# Altium project Zotino-DIOT.PrjPCB (part 5 of 5)

## Sheet Zotino-connector.SchDoc
size A3
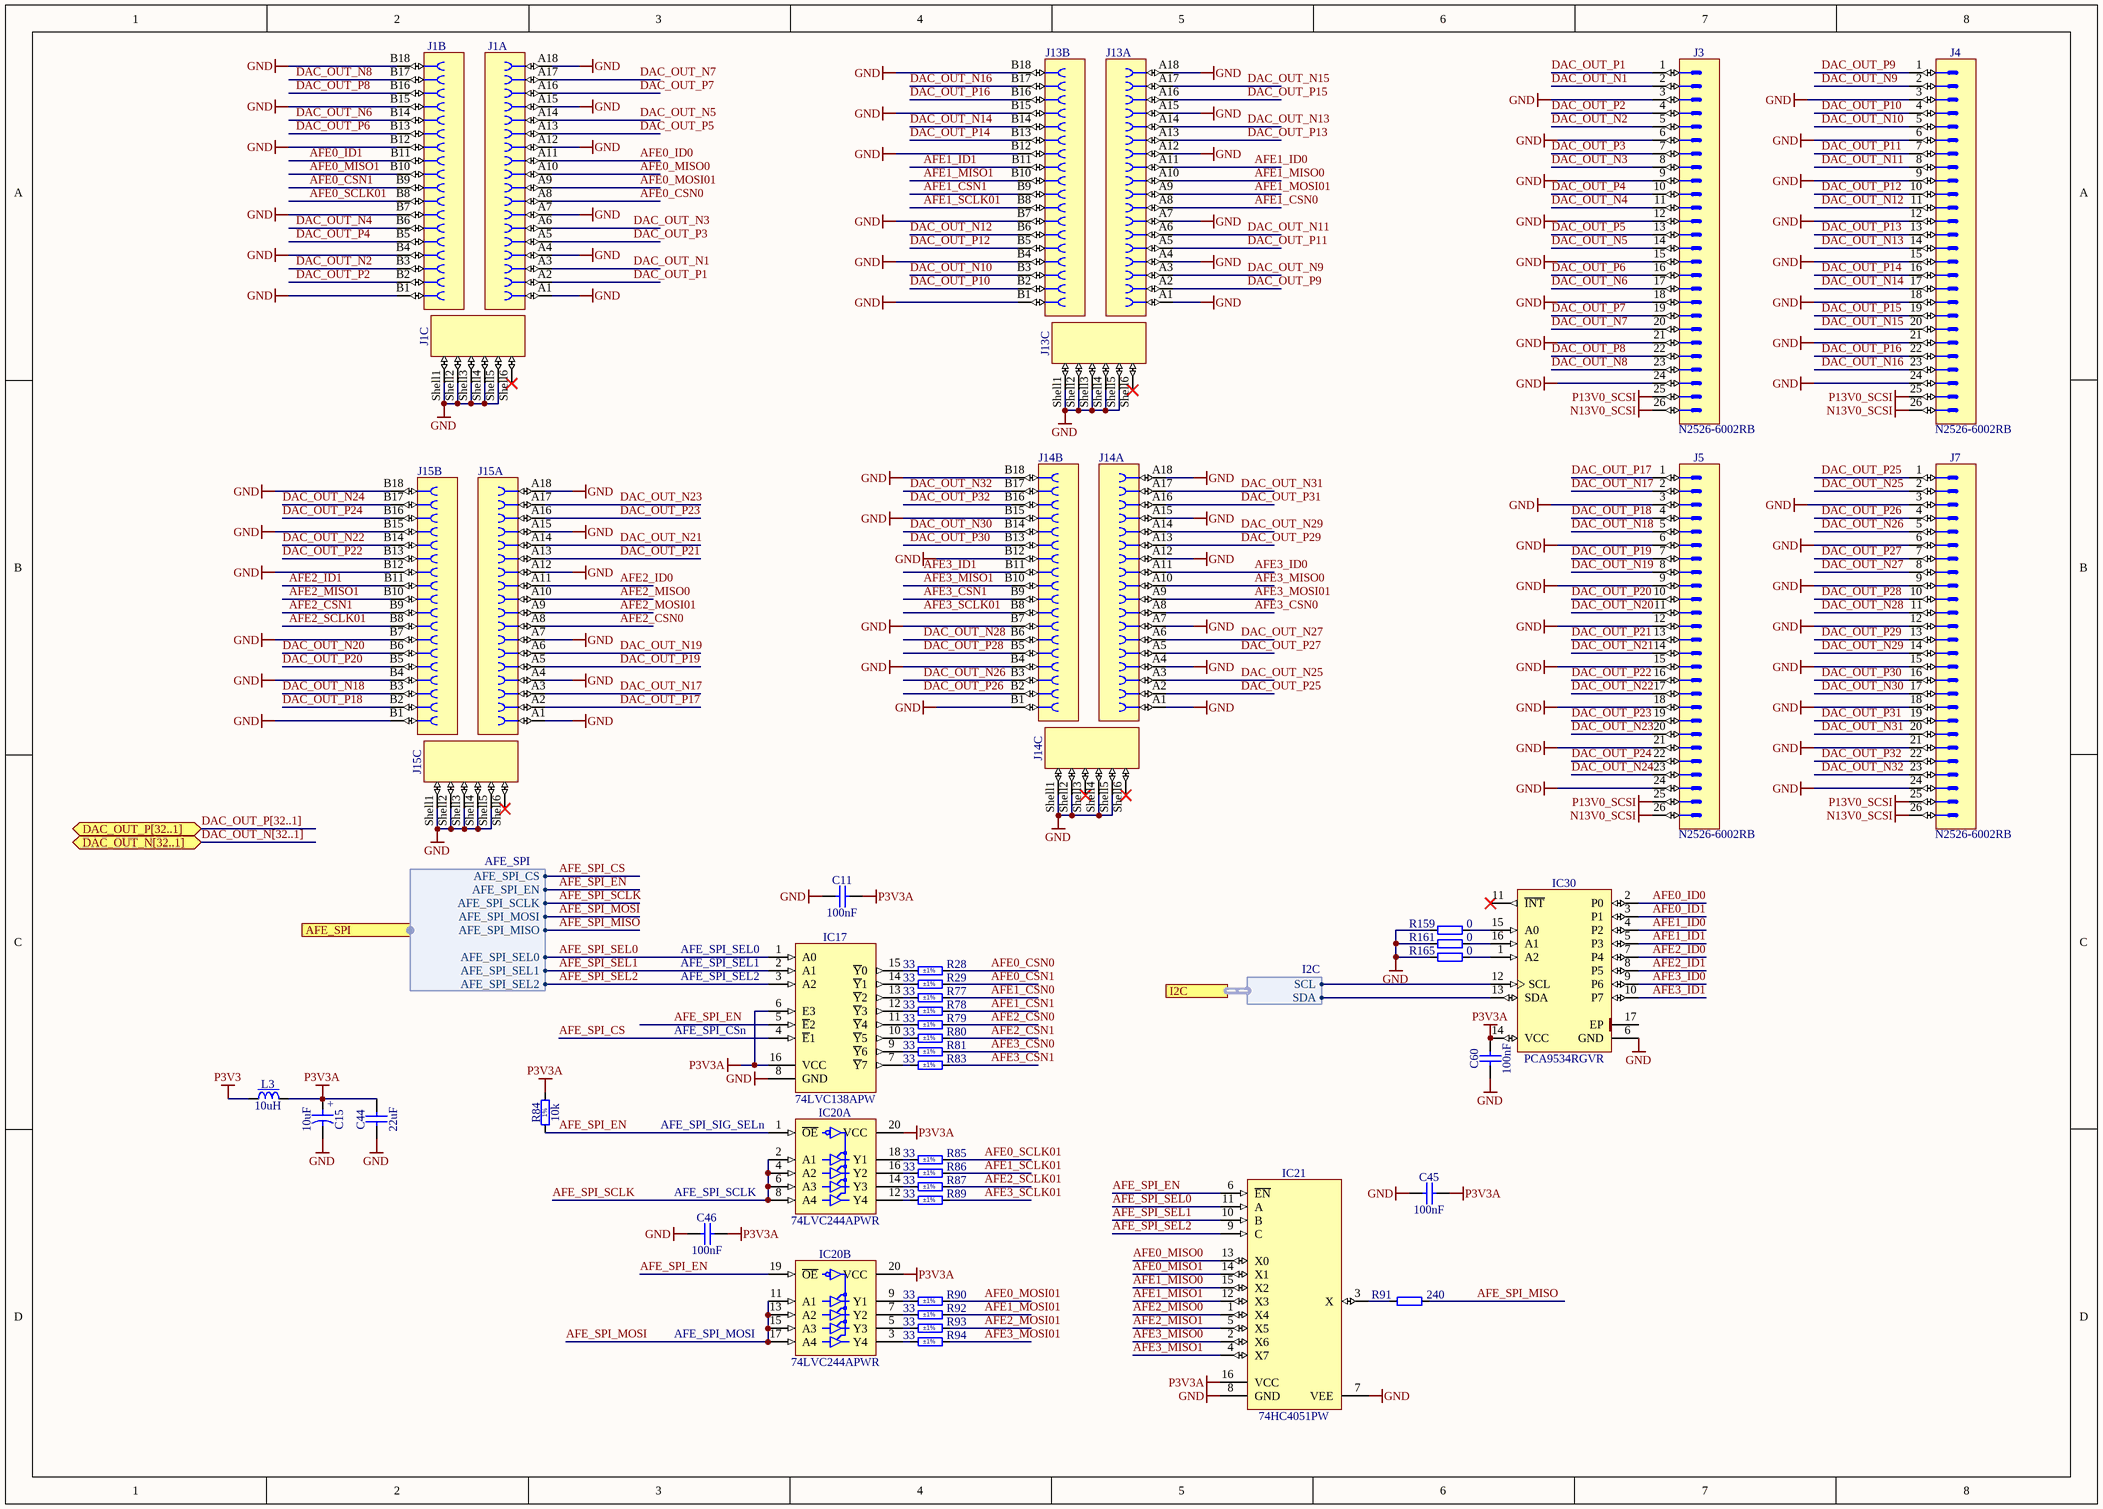
[diagram p7: Zotino-connector.SchDoc]

### Parts
C11  100nF  [CAPC1005X55N]
C15  10uF  [CAPMP3216X180N]
C44  22uF  [CAPC2012X135N]
C45  100nF  [CAPC1005X55N]
C46  100nF  [CAPC1005X55N]
C60  100nF  [CAPC1005X55N]
IC17  74LVC138APW  [SOP65P640X110-16N]
IC20  74LVC244APWR  [SOP65P640X110-20N]  (parts A,B of 2)
IC21  74HC4051PW  [SOP65P640X120-16N]
IC30  PCA9534RGVR  [QFN65P400X400X100-17N-S225]
J1  iPass™  [MOLEX_75783-0107]  (value not drawn)  (parts A,B,C of 3)
J3  Manufacturer Part Number: N2526-6002RB  [3M_N2526-6002RB]  (hidden comment: Header 26)
J4  Manufacturer Part Number: N2526-6002RB  [3M_N2526-6002RB]  (hidden comment: Header 26)
J5  Manufacturer Part Number: N2526-6002RB  [3M_N2526-6002RB]  (hidden comment: Header 26)
J7  Manufacturer Part Number: N2526-6002RB  [3M_N2526-6002RB]  (hidden comment: Header 26)
J13  iPass™  [MOLEX_75783-0107]  (value not drawn)  (parts A,B,C of 3)
J14  iPass™  [MOLEX_75783-0107]  (value not drawn)  (parts A,B,C of 3)
J15  iPass™  [MOLEX_75783-0107]  (value not drawn)  (parts A,B,C of 3)
L3  10uH  [IND_MURATA-PS_8400]
R28  33  Tolerance: ±1%  [RESC1005X40N]
R29  33  Tolerance: ±1%  [RESC1005X40N]
R77  33  Tolerance: ±1%  [RESC1005X40N]
R78  33  Tolerance: ±1%  [RESC1005X40N]
R79  33  Tolerance: ±1%  [RESC1005X40N]
R80  33  Tolerance: ±1%  [RESC1005X40N]
R81  33  Tolerance: ±1%  [RESC1005X40N]
R83  33  Tolerance: ±1%  [RESC1005X40N]
R84  10k  [RESC1005X40N]
R85  33  Tolerance: ±1%  [RESC1005X40N]
R86  33  Tolerance: ±1%  [RESC1005X40N]
R87  33  Tolerance: ±1%  [RESC1005X40N]
R89  33  Tolerance: ±1%  [RESC1005X40N]
R90  33  Tolerance: ±1%  [RESC1005X40N]
R91  240  [RESC1005X40N]
R92  33  Tolerance: ±1%  [RESC1005X40N]
R93  33  Tolerance: ±1%  [RESC1005X40N]
R94  33  Tolerance: ±1%  [RESC1005X40N]
R159  0  [RESC1005X40N]
R161  0  [RESC1005X40N]
R165  0  [RESC1005X40N]

### Ports
AFE_SPI (harness AFE_SPI), DAC_OUT_N[32..1] (bidir), DAC_OUT_P[32..1] (bidir), I2C (harness I2C)

### Harnesses
AFE_SPI: AFE_SPI_CS, AFE_SPI_EN, AFE_SPI_SCLK, AFE_SPI_MOSI, AFE_SPI_MISO, AFE_SPI_SEL0, AFE_SPI_SEL1, AFE_SPI_SEL2
I2C: SDA, SCL

### Nets
GND: C11.1 C15.2 C44.1 C45.1 C46.1 C60.1 IC17.8(GND) IC20.10(GND) IC21.7(VEE) IC21.8(GND) IC30.6(GND) J1.A1 J1.A4 J1.A7 J1.A12 J1.A15 J1.A18 J1.B1 J1.B4 J1.B7 J1.B12 J1.B15 J1.B18 J1.Shell1 J1.Shell2 J1.Shell3 J1.Shell4 J1.Shell5 J3.3 J3.6 J3.9 J3.12 J3.15 J3.18 J3.21 J3.24 J4.3 J4.6 J4.9 J4.12 J4.15 J4.18 J4.21 J4.24 J5.3 J5.6 J5.9 J5.12 J5.15 J5.18 J5.21 J5.24 J7.3 J7.6 J7.9 J7.12 J7.15 J7.18 J7.21 J7.24 J13.A1 J13.A4 J13.A7 J13.A12 J13.A15 J13.A18 J13.B1 J13.B4 J13.B7 J13.B12 J13.B15 J13.B18 J13.Shell1 J13.Shell2 J13.Shell3 J13.Shell4 J13.Shell5 J14.A1 J14.A4 J14.A7 J14.A12 J14.A15 J14.A18 J14.B1 J14.B4 J14.B7 J14.B12 J14.B15 J14.B18 J14.Shell1 J14.Shell2 J14.Shell4 J14.Shell5 J15.A1 J15.A4 J15.A7 J15.A12 J15.A15 J15.A18 J15.B1 J15.B4 J15.B7 J15.B12 J15.B15 J15.B18 J15.Shell1 J15.Shell2 J15.Shell3 J15.Shell4 J15.Shell5 R159.1 R161.1 R165.1
N13V0_SCSI: J3.26 J4.26 J5.26 J7.26
P3V3: L3.1
P3V3A: C11.2 C15.1 C44.2 C45.2 C46.2 C60.2 IC17.6(E3) IC17.16(VCC) IC20.20(VCC) IC21.16(VCC) IC30.14(VCC) L3.2 R84.2
P13V0_SCSI: J3.25 J4.25 J5.25 J7.25
AFE0_CSN0: J1.A8 R28.2
AFE0_CSN1: J1.B9 R29.2
AFE0_ID0: IC30.2(P0) J1.A11
AFE0_ID1: IC30.3(P1) J1.B11
AFE0_MISO0: IC21.13(X0) J1.A10
AFE0_MISO1: IC21.14(X1) J1.B10
AFE0_MOSI01: J1.A9 R90.2
AFE0_SCLK01: J1.B8 R85.2
AFE1_CSN0: J13.A8 R77.2
AFE1_CSN1: J13.B9 R78.2
AFE1_ID0: IC30.4(P2) J13.A11
AFE1_ID1: IC30.5(P3) J13.B11
AFE1_MISO0: IC21.15(X2) J13.A10
AFE1_MISO1: IC21.12(X3) J13.B10
AFE1_MOSI01: J13.A9 R92.2
AFE1_SCLK01: J13.B8 R86.2
AFE2_CSN0: J15.A8 R79.2
AFE2_CSN1: J15.B9 R80.2
AFE2_ID0: IC30.7(P4) J15.A11
AFE2_ID1: IC30.8(P5) J15.B11
AFE2_MISO0: IC21.1(X4) J15.A10
AFE2_MISO1: IC21.5(X5) J15.B10
AFE2_MOSI01: J15.A9 R93.2
AFE2_SCLK01: J15.B8 R87.2
AFE3_CSN0: J14.A8 R81.2
AFE3_CSN1: J14.B9 R83.2
AFE3_ID0: IC30.9(P6) J14.A11
AFE3_ID1: IC30.10(P7) J14.B11
AFE3_MISO0: IC21.2(X6) J14.A10
AFE3_MISO1: IC21.4(X7) J14.B10
AFE3_MOSI01: J14.A9 R94.2
AFE3_SCLK01: J14.B8 R89.2
AFE_SPI_CS: IC17.4(~{E}1) ; port AFE_SPI.AFE_SPI_CS
AFE_SPI_EN: IC17.5(~{E}2) IC20.1(~{OE}) IC20.19(~{OE}) IC21.6(~{EN}) R84.1 ; port AFE_SPI.AFE_SPI_EN
AFE_SPI_MISO: R91.2 ; port AFE_SPI.AFE_SPI_MISO
AFE_SPI_MOSI: IC20.11(A1) IC20.13(A2) IC20.15(A3) IC20.17(A4) ; port AFE_SPI.AFE_SPI_MOSI
AFE_SPI_SCLK: IC20.2(A1) IC20.4(A2) IC20.6(A3) IC20.8(A4) ; port AFE_SPI.AFE_SPI_SCLK
AFE_SPI_SEL0: IC17.1(A0) IC21.11(A) ; port AFE_SPI.AFE_SPI_SEL0
AFE_SPI_SEL1: IC17.2(A1) IC21.10(B) ; port AFE_SPI.AFE_SPI_SEL1
AFE_SPI_SEL2: IC17.3(A2) IC21.9(C) ; port AFE_SPI.AFE_SPI_SEL2
DAC_OUT_N1: J1.A3 J3.2
DAC_OUT_N2: J1.B3 J3.5
DAC_OUT_N3: J1.A6 J3.8
DAC_OUT_N4: J1.B6 J3.11
DAC_OUT_N5: J1.A14 J3.14
DAC_OUT_N6: J1.B14 J3.17
DAC_OUT_N7: J1.A17 J3.20
DAC_OUT_N8: J1.B17 J3.23
DAC_OUT_N9: J4.2 J13.A3
DAC_OUT_N10: J4.5 J13.B3
DAC_OUT_N11: J4.8 J13.A6
DAC_OUT_N12: J4.11 J13.B6
DAC_OUT_N13: J4.14 J13.A14
DAC_OUT_N14: J4.17 J13.B14
DAC_OUT_N15: J4.20 J13.A17
DAC_OUT_N16: J4.23 J13.B17
DAC_OUT_N17: J5.2 J15.A3
DAC_OUT_N18: J5.5 J15.B3
DAC_OUT_N19: J5.8 J15.A6
DAC_OUT_N20: J5.11 J15.B6
DAC_OUT_N21: J5.14 J15.A14
DAC_OUT_N22: J5.17 J15.B14
DAC_OUT_N23: J5.20 J15.A17
DAC_OUT_N24: J5.23 J15.B17
DAC_OUT_N25: J7.2 J14.A3
DAC_OUT_N26: J7.5 J14.B3
DAC_OUT_N27: J7.8 J14.A6
DAC_OUT_N28: J7.11 J14.B6
DAC_OUT_N29: J7.14 J14.A14
DAC_OUT_N30: J7.17 J14.B14
DAC_OUT_N31: J7.20 J14.A17
DAC_OUT_N32: J7.23 J14.B17
DAC_OUT_P1: J1.A2 J3.1
DAC_OUT_P2: J1.B2 J3.4
DAC_OUT_P3: J1.A5 J3.7
DAC_OUT_P4: J1.B5 J3.10
DAC_OUT_P5: J1.A13 J3.13
DAC_OUT_P6: J1.B13 J3.16
DAC_OUT_P7: J1.A16 J3.19
DAC_OUT_P8: J1.B16 J3.22
DAC_OUT_P9: J4.1 J13.A2
DAC_OUT_P10: J4.4 J13.B2
DAC_OUT_P11: J4.7 J13.A5
DAC_OUT_P12: J4.10 J13.B5
DAC_OUT_P13: J4.13 J13.A13
DAC_OUT_P14: J4.16 J13.B13
DAC_OUT_P15: J4.19 J13.A16
DAC_OUT_P16: J4.22 J13.B16
DAC_OUT_P17: J5.1 J15.A2
DAC_OUT_P18: J5.4 J15.B2
DAC_OUT_P19: J5.7 J15.A5
DAC_OUT_P20: J5.10 J15.B5
DAC_OUT_P21: J5.13 J15.A13
DAC_OUT_P22: J5.16 J15.B13
DAC_OUT_P23: J5.19 J15.A16
DAC_OUT_P24: J5.22 J15.B16
DAC_OUT_P25: J7.1 J14.A2
DAC_OUT_P26: J7.4 J14.B2
DAC_OUT_P27: J7.7 J14.A5
DAC_OUT_P28: J7.10 J14.B5
DAC_OUT_P29: J7.13 J14.A13
DAC_OUT_P30: J7.16 J14.B13
DAC_OUT_P31: J7.19 J14.A16
DAC_OUT_P32: J7.22 J14.B16
I2C_SCL: IC30.12(SCL) ; port I2C.SCL
I2C_SDA: IC30.13(SDA) ; port I2C.SDA
NetIC17_7: IC17.7(~{Y}7) R83.1
NetIC17_9: IC17.9(~{Y}6) R81.1
NetIC17_10: IC17.10(~{Y}5) R80.1
NetIC17_11: IC17.11(~{Y}4) R79.1
NetIC17_12: IC17.12(~{Y}3) R78.1
NetIC17_13: IC17.13(~{Y}2) R77.1
NetIC17_14: IC17.14(~{Y}1) R29.1
NetIC17_15: IC17.15(~{Y}0) R28.1
NetIC20_3: IC20.3(Y4) R94.1
NetIC20_5: IC20.5(Y3) R93.1
NetIC20_7: IC20.7(Y2) R92.1
NetIC20_9: IC20.9(Y1) R90.1
NetIC20_12: IC20.12(Y4) R89.1
NetIC20_14: IC20.14(Y3) R87.1
NetIC20_16: IC20.16(Y2) R86.1
NetIC20_18: IC20.18(Y1) R85.1
NetIC21_3: IC21.3(X) R91.1
NetIC30_1: IC30.1(A2) R165.2
NetIC30_15: IC30.15(A0) R159.2
NetIC30_16: IC30.16(A1) R161.2

Not connected (* = marked no-connect by the designer): IC30 11(~{INT})* 17(EP); J1 Shell6*; J13 Shell6*; J14 Shell3* Shell6*; J15 Shell6*

### Buses and harness runs
bus DAC_OUT_N[32..1] = port DAC_OUT_N[32..1]
bus DAC_OUT_P[32..1] = port DAC_OUT_P[32..1]

### Notes on the sheet
- (near IC17) AFE_SPI_SEL0
- (near IC17) AFE_SPI_SEL1
- (near IC17) AFE_SPI_SEL2
- AFE_SPI_CSn
- AFE_SPI_SIG_SELn
- AFE_SPI_SCLK
- (near IC20) AFE_SPI_MOSI
- (in symbol CTE3216-18_10UF_16V_20%_AVX_TCJ) +
- (in symbol R0402_10K_1%_0.0625W_100PPM) 1%

### Library data of the parts
C11 C45 C46 C60 = CC0402_100NF_16V_10%_X5R: Non-polarised capacitor; Part Description: SMD Multilayer Chip Ceramic Capacitor; Manufacturer: GENERIC; Manufacturer1 Part Number: GRM155R61C104KA88D; Voltage: 16V; TC: X5R; Tolerance: ±10%; Part Number: CC0402_100NF_16V_10%_X5R; Component Kind: Standard; Component Type: Standard; Pin Count: 2; Value: 100nF; Status: None; Manufacturer Part Number: CC0402_100NF_16V_10%_X5R; Case: 0402; Mounted: Yes; Socket: No; SMD: Yes; Sense: No; Manufacturer1 Example: MURATA; Manufacturer1 ComponentHeight: 0.55mm; HelpURL: \\cern.ch\dfs\Applications\Altium\Datasheets\CC0402_X5R_MURATA_GRM.pdf; Author: CERN DEM JLC; CreateDate: 10.12.2013; LatestRevisionDate: 10.12.2013
C15 = CTE3216-18_10UF_16V_20%_AVX_TCJ: Polarised capacitor; Part Description: ESR 0R200 Tantalum Solid Electrolytic Chip Capacitor with Conductive Polymer Electrode; Manufacturer: AVX; Manufacturer Part Number: TCJA106M016R0200 or  or TR3A106K016C1700; Voltage: 16V; Tolerance: ±20%; Part Number: CTE3216-18_10UF_16V_20%_AVX_TCJ; Component Kind: Standard; Component Type: Standard; Pin Count: 2; Value: 10uF; Status: Preferred; Case: A; Mounted: Yes; Socket: No; SMD: Yes; Sense: No; ComponentHeight: 1.8mm; HelpURL: \\cern.ch\dfs\Applications\Altium\Datasheets\CTE_AVX_TCJ.pdf; Author: CERN DEM JLC; CreateDate: 29.03.2012; LatestRevisionDate: 29.03.2012
C44 = CC0805_22UF_16V_10%_X5R: Non-polarised capacitor; Part Description: SMD Multilayer Chip Ceramic Capacitor; Manufacturer: GENERIC; Manufacturer1 Part Number: C2012X5R1C226KT; Voltage: 16V; TC: X5R; Tolerance: ±10%; Part Number: CC0805_22UF_16V_10%_X5R; Component Kind: Standard; Component Type: Standard; Pin Count: 2; Value: 22uF; Status: Preferred; Manufacturer Part Number: CC0805_22UF_16V_10%_X5R; Case: 0805; Mounted: Yes; Socket: No; SMD: Yes; Sense: No; Manufacturer1 Example: TDK; Manufacturer1 ComponentHeight: 1.35mm; HelpURL: \\cern.ch\dfs\Applications\Altium\Datasheets\CC0805_X5R_TDK_C.pdf; Author: CERN DEM JLC; CreateDate: 25.10.2012; LatestRevisionDate: 25.10.2012
IC17 = 74LVC138APW: 3-Line to 8-Line Decoder/Demultiplexer; Part Description: 3-Line to 8-Line Decoder/Demultiplexer, Inverting; Manufacturer: NEXPERIA; PressFit: No; Bonding: No; Part Number: 74LVC138APW; Component Kind: Standard; Component Type: Standard; Device: 74LVC138APW; PackageDescription: SOP, 0.65mm Pitch; 16 Pin, 4.40mm W X 5.00mm L X 1.10mm H body IPC Medium Density; Manufacturer Part Number: 74LVC138APW; Pin Count: 16; Case: TSSOP16; Mounted: Yes; Socket: No; SMD: Yes; Sense: No; ComponentHeight: 1.1mm; Author: CERN DEM HF; HelpURL: \\cern.ch\dfs\Applications\Altium\Datasheets\74LVC138A.pdf; CreateDate: 14.10.2022; LatestRevisionDate: 14.10.2022
IC20 = 74LVC244APW: Octal Buffer/Driver with 3-State Ouputs; Part Description: Octal Buffer/Driver with 3-State Outputs; Manufacturer: TEXAS INSTRUMENTS; PressFit: No; Bonding: No; Part Number: 74LVC244APWR; Component Kind: Standard; Component Type: Standard; Device: 74LVC244APWR; PackageDescription: SOP, 20-Leads, Body 6.6x4.5mm (max), Pitch 0.65mm, IPC Medium Density; Manufacturer Part Number: 74LVC244APW; Pin Count: 20; Case: TSSOP20; Mounted: Yes; Socket: No; SMD: Yes; Sense: No; ComponentHeight: 1.1mm; Author: GK; HelpURL: \\cern.ch\dfs\Applications\Altium\Datasheets\SN74LVC244A.pdf; CreateDate: 20.12.2010; LatestRevisionDate: 22.03.2021
IC21 = 74HC4051PW: 8-Channel Analog Multiplexer/Demultiplexer; Manufacturer: NXP; PressFit: No; Bonding: No; Part Number: 74HC4051PW; Component Kind: Standard; Component Type: Standard; Device: 74HC4051PW; PackageDescription: SOP, 0.65mm Pitch; 16 Pin, 4.40mm W X 5.00mm L X 1.20mm H body, IPC Medium Density; Part Description: 8-Channel Analog Multiplexer/Demultiplexer; Manufacturer Part Number: 74HC4051PW; Pin Count: 16; Case: TSSOP16; Mounted: Yes; Socket: No; SMD: Yes; Sense: No; ComponentHeight: 1.2mm; Author: GK; HelpURL: \\cern.ch\dfs\Applications\Altium\Datasheets\TC74HC4051AFT.pdf; CreateDate: 09.11.2011; LatestRevisionDate: 09.11.2011
IC30 = PCA9534RGVR: Remote 8-Bit I2C and SMBus Low-Power I/O Expander With Interrupt Output and Configuration Registers; Manufacturer: TEXAS INSTRUMENTS; PressFit: No; Bonding: No; Part Number: PCA9534RGVR; Component Kind: Standard; Component Type: Standard; Device: PCA9534RGVR; PackageDescription: QFN, 0.65mm Pitch, Square; 16 Pin, 4.00mm L X 4.00mm W X 1.00mm H body (w/Thermal Tab 2.25 X 2.25mm), IPC Medium Density; Part Description: Remote 8-Bit I2C and SMBus Low-Power I/O Expander with Interrupt Output and Configuration Registers; Manufacturer Part Number: PCA9534RGV; Pin Count: 17; Case: QFN16; Mounted: Yes; Socket: No; SMD: Yes; Sense: No; ComponentHeight: 1mm; Author: CERN DEM JLC; HelpURL: \\cern.ch\dfs\Applications\Altium\Datasheets\PCA9534RGVR.pdf; CreateDate: 23.05.2018; LatestRevisionDate: 13.06.2022
J1 J13-J15 = MOLEX_75783-0107: 36 Circuit, Right Angle , Internal Assembly, iPass™ I/O Surface Mount Receptacle with Left Key Shell; Part Number: MOLEX 75783-0107 / 75783-0136; Manufacturer: MOLEX; Manufacturer Part Number: 75783-0107 / 75783-0136; PressFit: No; Component Kind: Standard; Component Type: Standard; Pin Count: 42; Family: iPass™; Mounted: Yes; Socket: No; SMD: Yes; Sense: No; Status: None; Part Description: 36 Circuit, Right Angle , Internal Assembly, iPass™ I/O Surface Mount Receptacle with Left Key Shell; ComponentHeight: 8.47mm; HelpURL: \\cern.ch\dfs\Applications\Altium\Datasheets\MOLEX_75783-0107.pdf; Author: CERN DEM JLC; CreateDate: 12.11.2014; LatestRevisionDate: 12.11.2014
J3-J5 J7 = 3M_N2526-6002RB: Connector 26 Male; Part Description: 26 Contacts - Straight .100'' x .100'' Low Profile Four-Wall Header, 2500 Series; Manufacturer: 3M; PressFit: No; Part Number: 3M_N2526-6002RB; Component Kind: Standard; Component Type: Standard; Pin Count: 26; Family: Header 26; Mounted: Yes; Socket: No; SMD: No; Sense: No; Status: None; ComponentHeight: 10.03mm; HelpURL: \\cern.ch\dfs\Applications\Altium\Datasheets\3M_N2526-6002RB.pdf; Author: CERN DEM JLC; CreateDate: 11.02.2009; LatestRevisionDate: 11.08.2009
L3 = IND_10UH_10%_MURATA-PS_8400: Inductor With Core; Part Description: Miniature Surface Mount Power Inductor (8400 Serie); Manufacturer: MURATA POWER SOLUTIONS; Manufacturer Part Number: 84103C; Power: 950mA; Resistance: 0.24R; Tolerance: ±10%; Part Number: IND_10UH_10%_MURATA-PS_8400; Component Kind: Standard; Component Type: Standard; Pin Count: 2; Value: 10uH; Status: None; Mounted: Yes; Socket: No; SMD: Yes; Sense: No; ComponentHeight: 2.9mm; HelpURL: \\cern.ch\dfs\Applications\Altium\Datasheets\IND_MURATA-PS_8400.pdf; Author: CERN DEM JLC; CreateDate: 02.07.2012; LatestRevisionDate: 02.07.2012
R28 R29 R77-R81 R83 R85-R87 R89 R90 R92-R94 = R0402_33R_1%_0.0625W_100PPM: Resistor - 1%; Part Description: General Purpose Thick Film Chip Resistor; Manufacturer: GENERIC; Manufacturer1 Part Number: 232270673309L; TC: ±100ppm/°C; PressFit: No; Part Number: R0402_33R_1%_0.0625W_100PPM; Component Kind: Standard; Component Type: Standard; Pin Count: 2; Value: 33; Status: Not Recommended; Power: 0.0625W; Manufacturer Part Number: R0402_33R_1%_0.0625W_100PPM; Case: 0402; Mounted: Yes; Sense: No; Socket: No; SMD: Yes; Manufacturer1 Example: YAGEO PHYCOMP; Manufacturer1 ComponentHeight: 0.4mm; HelpURL: \\cern.ch\dfs\Applications\Altium\Datasheets\R0402_Phycomp_RC0402.pdf; Author: CERN DEM JLC; CreateDate: 03.12.2007; LatestRevisionDate: 17.10.2012
R84 = R0402_10K_1%_0.0625W_100PPM: Resistor - 1%; Part Description: General Purpose Thick Film Chip Resistor; Manufacturer: GENERIC; Manufacturer1 Part Number: 232270671003L; TC: ±100ppm/°C; PressFit: No; Part Number: R0402_10K_1%_0.0625W_100PPM; Component Kind: Standard; Component Type: Standard; Pin Count: 2; Value: 10k; Status: Not Recommended; Power: 0.0625W; Tolerance: ±1%; Manufacturer Part Number: R0402_10K_1%_0.0625W_100PPM; Case: 0402; Mounted: Yes; Sense: No; Socket: No; SMD: Yes; Manufacturer1 Example: YAGEO PHYCOMP; Manufacturer1 ComponentHeight: 0.4mm; HelpURL: \\cern.ch\dfs\Applications\Altium\Datasheets\R0402_Phycomp_RC0402.pdf; Author: CERN DEM JLC; CreateDate: 03.12.2007; LatestRevisionDate: 17.10.2012
R91 = R0402_240R_1%_0.0625W_100PPM: Resistor - 1%; Part Description: General Purpose Thick Film Chip Resistor; Manufacturer: GENERIC; Manufacturer1 Part Number: 232270672401L; TC: ±100ppm/°C; PressFit: No; Part Number: R0402_240R_1%_0.0625W_100PPM; Component Kind: Standard; Component Type: Standard; Pin Count: 2; Value: 240; Status: Not Recommended; Power: 0.0625W; Tolerance: ±1%; Manufacturer Part Number: R0402_240R_1%_0.0625W_100PPM; Case: 0402; Mounted: Yes; Sense: No; Socket: No; SMD: Yes; Manufacturer1 Example: YAGEO PHYCOMP; Manufacturer1 ComponentHeight: 0.4mm; HelpURL: \\cern.ch\dfs\Applications\Altium\Datasheets\R0402_Phycomp_RC0402.pdf; Author: CERN DEM JLC; CreateDate: 03.12.2007; LatestRevisionDate: 17.10.2012
R159 R161 R165 = R0402_0R_JUMPER: Resistor; Part Description: 1A (0.05R Max DC Resistance) Zero Ohm Jumper; Manufacturer: GENERIC; Manufacturer1 Part Number: 232270591001L; PressFit: No; Part Number: R0402_0R_JUMPER; Component Kind: Standard; Component Type: Standard; Pin Count: 2; Value: 0; Status: Not Recommended; Manufacturer Part Number: R0402_0R_JUMPER; Case: 0402; Mounted: Yes; Sense: No; Socket: No; SMD: Yes; Manufacturer1 Example: YAGEO PHYCOMP; Manufacturer1 ComponentHeight: 0.4mm; HelpURL: \\cern.ch\dfs\Applications\Altium\Datasheets\R0402_Phycomp_RC0402.pdf; Author: CERN DEM JLC; CreateDate: 03.12.2007; LatestRevisionDate: 17.10.2012

## Nets that join several sheets
GND: Zotino-DIOT (38 pins), Supply_DAC (68 pins), U_Output_channel1 (8 pins), U_Output_channel2 (8 pins), U_Output_channel3 (8 pins), U_Output_channel4 (8 pins), U_Output_channel5 (8 pins), U_Output_channel6 (8 pins), U_Output_channel7 (8 pins), U_Output_channel8 (8 pins), U_Output_channel9 (8 pins), U_Output_channel10 (8 pins), U_Output_channel11 (8 pins), U_Output_channel12 (8 pins), U_Output_channel13 (8 pins), U_Output_channel14 (8 pins), U_Output_channel15 (8 pins), U_Output_channel16 (8 pins), U_Output_channel17 (8 pins), U_Output_channel18 (8 pins), U_Output_channel19 (8 pins), U_Output_channel20 (8 pins), U_Output_channel21 (8 pins), U_Output_channel22 (8 pins), U_Output_channel23 (8 pins), U_Output_channel24 (8 pins), U_Output_channel25 (8 pins), U_Output_channel26 (8 pins), U_Output_channel27 (8 pins), U_Output_channel28 (8 pins), U_Output_channel29 (8 pins), U_Output_channel30 (8 pins), U_Output_channel31 (8 pins), U_Output_channel32 (8 pins), DAC_32CH (35 pins), LVDS_IFC_DAC (107 pins), DIOT_Connectors_P1_P6 (64 pins), Zotino-connector (113 pins)
N12V0A: Zotino-DIOT (8 pins), Supply_DAC (11 pins), U_Output_channel1 (C92_1.2 C93_1.2 D5_1.1 IC2_1.4), U_Output_channel2 (C92_2.2 C93_2.2 D5_2.1 IC2_2.4), U_Output_channel3 (C92_3.2 C93_3.2 D5_3.1 IC2_3.4), U_Output_channel4 (C92_4.2 C93_4.2 D5_4.1 IC2_4.4), U_Output_channel5 (C92_5.2 C93_5.2 D5_5.1 IC2_5.4), U_Output_channel6 (C92_6.2 C93_6.2 D5_6.1 IC2_6.4), U_Output_channel7 (C92_7.2 C93_7.2 D5_7.1 IC2_7.4), U_Output_channel8 (C92_8.2 C93_8.2 D5_8.1 IC2_8.4), U_Output_channel9 (C92_9.2 C93_9.2 D5_9.1 IC2_9.4), U_Output_channel10 (C92_10.2 C93_10.2 D5_10.1 IC2_10.4), U_Output_channel11 (C92_11.2 C93_11.2 D5_11.1 IC2_11.4), U_Output_channel12 (C92_12.2 C93_12.2 D5_12.1 IC2_12.4), U_Output_channel13 (C92_13.2 C93_13.2 D5_13.1 IC2_13.4), U_Output_channel14 (C92_14.2 C93_14.2 D5_14.1 IC2_14.4), U_Output_channel15 (C92_15.2 C93_15.2 D5_15.1 IC2_15.4), U_Output_channel16 (C92_16.2 C93_16.2 D5_16.1 IC2_16.4), U_Output_channel17 (C92_17.2 C93_17.2 D5_17.1 IC2_17.4), U_Output_channel18 (C92_18.2 C93_18.2 D5_18.1 IC2_18.4), U_Output_channel19 (C92_19.2 C93_19.2 D5_19.1 IC2_19.4), U_Output_channel20 (C92_20.2 C93_20.2 D5_20.1 IC2_20.4), U_Output_channel21 (C92_21.2 C93_21.2 D5_21.1 IC2_21.4), U_Output_channel22 (C92_22.2 C93_22.2 D5_22.1 IC2_22.4), U_Output_channel23 (C92_23.2 C93_23.2 D5_23.1 IC2_23.4), U_Output_channel24 (C92_24.2 C93_24.2 D5_24.1 IC2_24.4), U_Output_channel25 (C92_25.2 C93_25.2 D5_25.1 IC2_25.4), U_Output_channel26 (C92_26.2 C93_26.2 D5_26.1 IC2_26.4), U_Output_channel27 (C92_27.2 C93_27.2 D5_27.1 IC2_27.4), U_Output_channel28 (C92_28.2 C93_28.2 D5_28.1 IC2_28.4), U_Output_channel29 (C92_29.2 C93_29.2 D5_29.1 IC2_29.4), U_Output_channel30 (C92_30.2 C93_30.2 D5_30.1 IC2_30.4), U_Output_channel31 (C92_31.2 C93_31.2 D5_31.1 IC2_31.4), U_Output_channel32 (C92_32.2 C93_32.2 D5_32.1 IC2_32.4), DAC_32CH (8 pins)
N13V0_SCSI: Supply_DAC (R32.2), Zotino-connector (J3.26 J4.26 J5.26 J7.26)
P3V3: Zotino-DIOT (5 pins), Supply_DAC (12 pins), DAC_32CH (L1.1), LVDS_IFC_DAC (57 pins), Zotino-connector (L3.1)
P3V3_MP: LVDS_IFC_DAC (14 pins), DIOT_Connectors_P1_P6 (D7.1)
P12V0: Zotino-DIOT (J2.10), Supply_DAC (C10.1 C129.2 L8.2 R30.1), LVDS_IFC_DAC (8 pins)
P12V0_CPCIS: LVDS_IFC_DAC (R65.1 R66.1 R71.1 R72.1), DIOT_Connectors_P1_P6 (10 pins)
P12V0A: Supply_DAC (8 pins), U_Output_channel1 (C90_1.1 C91_1.2 D5_1.2 IC2_1.7), U_Output_channel2 (C90_2.1 C91_2.2 D5_2.2 IC2_2.7), U_Output_channel3 (C90_3.1 C91_3.2 D5_3.2 IC2_3.7), U_Output_channel4 (C90_4.1 C91_4.2 D5_4.2 IC2_4.7), U_Output_channel5 (C90_5.1 C91_5.2 D5_5.2 IC2_5.7), U_Output_channel6 (C90_6.1 C91_6.2 D5_6.2 IC2_6.7), U_Output_channel7 (C90_7.1 C91_7.2 D5_7.2 IC2_7.7), U_Output_channel8 (C90_8.1 C91_8.2 D5_8.2 IC2_8.7), U_Output_channel9 (C90_9.1 C91_9.2 D5_9.2 IC2_9.7), U_Output_channel10 (C90_10.1 C91_10.2 D5_10.2 IC2_10.7), U_Output_channel11 (C90_11.1 C91_11.2 D5_11.2 IC2_11.7), U_Output_channel12 (C90_12.1 C91_12.2 D5_12.2 IC2_12.7), U_Output_channel13 (C90_13.1 C91_13.2 D5_13.2 IC2_13.7), U_Output_channel14 (C90_14.1 C91_14.2 D5_14.2 IC2_14.7), U_Output_channel15 (C90_15.1 C91_15.2 D5_15.2 IC2_15.7), U_Output_channel16 (C90_16.1 C91_16.2 D5_16.2 IC2_16.7), U_Output_channel17 (C90_17.1 C91_17.2 D5_17.2 IC2_17.7), U_Output_channel18 (C90_18.1 C91_18.2 D5_18.2 IC2_18.7), U_Output_channel19 (C90_19.1 C91_19.2 D5_19.2 IC2_19.7), U_Output_channel20 (C90_20.1 C91_20.2 D5_20.2 IC2_20.7), U_Output_channel21 (C90_21.1 C91_21.2 D5_21.2 IC2_21.7), U_Output_channel22 (C90_22.1 C91_22.2 D5_22.2 IC2_22.7), U_Output_channel23 (C90_23.1 C91_23.2 D5_23.2 IC2_23.7), U_Output_channel24 (C90_24.1 C91_24.2 D5_24.2 IC2_24.7), U_Output_channel25 (C90_25.1 C91_25.2 D5_25.2 IC2_25.7), U_Output_channel26 (C90_26.1 C91_26.2 D5_26.2 IC2_26.7), U_Output_channel27 (C90_27.1 C91_27.2 D5_27.2 IC2_27.7), U_Output_channel28 (C90_28.1 C91_28.2 D5_28.2 IC2_28.7), U_Output_channel29 (C90_29.1 C91_29.2 D5_29.2 IC2_29.7), U_Output_channel30 (C90_30.1 C91_30.2 D5_30.2 IC2_30.7), U_Output_channel31 (C90_31.1 C91_31.2 D5_31.2 IC2_31.7), U_Output_channel32 (C90_32.1 C91_32.2 D5_32.2 IC2_32.7), DAC_32CH (8 pins)
P13V0_SCSI: Supply_DAC (R30.2 R31.2), Zotino-connector (J3.25 J4.25 J5.25 J7.25)
AFE_SPI_CS: LVDS_IFC_DAC (R110.1), Zotino-connector (IC17.4)
AFE_SPI_EN: LVDS_IFC_DAC (R125.1), Zotino-connector (5 pins)
AFE_SPI_MISO: LVDS_IFC_DAC (R107.1), Zotino-connector (R91.2)
AFE_SPI_MOSI: LVDS_IFC_DAC (R104.1), Zotino-connector (IC20.11 IC20.13 IC20.15 IC20.17)
AFE_SPI_SCLK: LVDS_IFC_DAC (R100.1), Zotino-connector (IC20.2 IC20.4 IC20.6 IC20.8)
AFE_SPI_SEL0: LVDS_IFC_DAC (R128.1), Zotino-connector (IC17.1 IC21.11)
AFE_SPI_SEL1: LVDS_IFC_DAC (R131.1), Zotino-connector (IC17.2 IC21.10)
AFE_SPI_SEL2: LVDS_IFC_DAC (R135.1), Zotino-connector (IC17.3 IC21.9)
BP_I2C.SCL: LVDS_IFC_DAC (R46.1), DIOT_Connectors_P1_P6 (D5.3 J8.B2)
BP_I2C.SDA: LVDS_IFC_DAC (R45.1), DIOT_Connectors_P1_P6 (D5.1 J8.C2)
BP_IO.LVDS_N0: LVDS_IFC_DAC (R56.1), DIOT_Connectors_P1_P6 (J8.E3)
BP_IO.LVDS_N1: LVDS_IFC_DAC (R57.1), DIOT_Connectors_P1_P6 (J8.B3)
BP_IO.LVDS_N2: LVDS_IFC_DAC (R59.1), DIOT_Connectors_P1_P6 (J8.C4)
BP_IO.LVDS_N3: LVDS_IFC_DAC (R60.1), DIOT_Connectors_P1_P6 (J8.L4)
BP_IO.LVDS_N4: LVDS_IFC_DAC (R61.1), DIOT_Connectors_P1_P6 (J8.I4)
BP_IO.LVDS_N5: LVDS_IFC_DAC (R62.1), DIOT_Connectors_P1_P6 (J8.K5)
BP_IO.LVDS_N6: LVDS_IFC_DAC (R63.1), DIOT_Connectors_P1_P6 (J8.H5)
BP_IO.LVDS_N7: LVDS_IFC_DAC (R64.1), DIOT_Connectors_P1_P6 (J8.F6)
BP_IO.LVDS_N8: LVDS_IFC_DAC (R146.1), DIOT_Connectors_P1_P6 (J8.C6)
BP_IO.LVDS_N9: LVDS_IFC_DAC (R148.1), DIOT_Connectors_P1_P6 (J8.L6)
BP_IO.LVDS_N10: LVDS_IFC_DAC (R149.1), DIOT_Connectors_P1_P6 (J8.I6)
BP_IO.LVDS_N11: LVDS_IFC_DAC (R152.1), DIOT_Connectors_P1_P6 (J9.E1)
BP_IO.LVDS_N12: LVDS_IFC_DAC (R154.1), DIOT_Connectors_P1_P6 (J9.B1)
BP_IO.LVDS_N13: LVDS_IFC_DAC (R155.1), DIOT_Connectors_P1_P6 (J9.K1)
BP_IO.LVDS_N14: LVDS_IFC_DAC (R156.1), DIOT_Connectors_P1_P6 (J9.H1)
BP_IO.LVDS_N15: LVDS_IFC_DAC (R158.1), DIOT_Connectors_P1_P6 (J8.F2)
BP_IO.LVDS_P0: LVDS_IFC_DAC (R47.1), DIOT_Connectors_P1_P6 (J8.D3)
BP_IO.LVDS_P1: LVDS_IFC_DAC (R48.1), DIOT_Connectors_P1_P6 (J8.A3)
BP_IO.LVDS_P2: LVDS_IFC_DAC (R49.1), DIOT_Connectors_P1_P6 (J8.B4)
BP_IO.LVDS_P3: LVDS_IFC_DAC (R50.1), DIOT_Connectors_P1_P6 (J8.K4)
BP_IO.LVDS_P4: LVDS_IFC_DAC (R52.1), DIOT_Connectors_P1_P6 (J8.H4)
BP_IO.LVDS_P5: LVDS_IFC_DAC (R53.1), DIOT_Connectors_P1_P6 (J8.J5)
BP_IO.LVDS_P6: LVDS_IFC_DAC (R54.1), DIOT_Connectors_P1_P6 (J8.G5)
BP_IO.LVDS_P7: LVDS_IFC_DAC (R55.1), DIOT_Connectors_P1_P6 (J8.E6)
BP_IO.LVDS_P8: LVDS_IFC_DAC (R136.1), DIOT_Connectors_P1_P6 (J8.B6)
BP_IO.LVDS_P9: LVDS_IFC_DAC (R137.1), DIOT_Connectors_P1_P6 (J8.K6)
BP_IO.LVDS_P10: LVDS_IFC_DAC (R138.1), DIOT_Connectors_P1_P6 (J8.H6)
BP_IO.LVDS_P11: LVDS_IFC_DAC (R139.1), DIOT_Connectors_P1_P6 (J9.D1)
BP_IO.LVDS_P12: LVDS_IFC_DAC (R140.1), DIOT_Connectors_P1_P6 (J9.A1)
BP_IO.LVDS_P13: LVDS_IFC_DAC (R142.1), DIOT_Connectors_P1_P6 (J9.J1)
BP_IO.LVDS_P14: LVDS_IFC_DAC (R143.1), DIOT_Connectors_P1_P6 (J9.G1)
BP_IO.LVDS_P15: LVDS_IFC_DAC (R145.1), DIOT_Connectors_P1_P6 (J8.E2)
BUSY: DAC_32CH (IC5.2 IC18.2), LVDS_IFC_DAC (R51.1)
CLRn: DAC_32CH (IC5.64 IC18.64 TP15.1), LVDS_IFC_DAC (R88.1)
CSn: DAC_32CH (IC5.53 IC18.53 TP4.1), LVDS_IFC_DAC (R97.1)
CSN_EXT: Zotino-DIOT (IC23.12 R118.2 TP18.1), LVDS_IFC_DAC (R99.1)
DAC_OUT_N1: U_Output_channel1 (L4_1.3), Zotino-connector (J1.A3 J3.2)
DAC_OUT_N2: U_Output_channel2 (L4_2.3), Zotino-connector (J1.B3 J3.5)
DAC_OUT_N3: U_Output_channel3 (L4_3.3), Zotino-connector (J1.A6 J3.8)
DAC_OUT_N4: U_Output_channel4 (L4_4.3), Zotino-connector (J1.B6 J3.11)
DAC_OUT_N5: U_Output_channel5 (L4_5.3), Zotino-connector (J1.A14 J3.14)
DAC_OUT_N6: U_Output_channel6 (L4_6.3), Zotino-connector (J1.B14 J3.17)
DAC_OUT_N7: U_Output_channel7 (L4_7.3), Zotino-connector (J1.A17 J3.20)
DAC_OUT_N8: U_Output_channel8 (L4_8.3), Zotino-connector (J1.B17 J3.23)
DAC_OUT_N9: U_Output_channel9 (L4_9.3), Zotino-connector (J4.2 J13.A3)
DAC_OUT_N10: U_Output_channel10 (L4_10.3), Zotino-connector (J4.5 J13.B3)
DAC_OUT_N11: U_Output_channel11 (L4_11.3), Zotino-connector (J4.8 J13.A6)
DAC_OUT_N12: U_Output_channel12 (L4_12.3), Zotino-connector (J4.11 J13.B6)
DAC_OUT_N13: U_Output_channel13 (L4_13.3), Zotino-connector (J4.14 J13.A14)
DAC_OUT_N14: U_Output_channel14 (L4_14.3), Zotino-connector (J4.17 J13.B14)
DAC_OUT_N15: U_Output_channel15 (L4_15.3), Zotino-connector (J4.20 J13.A17)
DAC_OUT_N16: U_Output_channel16 (L4_16.3), Zotino-connector (J4.23 J13.B17)
DAC_OUT_N17: U_Output_channel17 (L4_17.3), Zotino-connector (J5.2 J15.A3)
DAC_OUT_N18: U_Output_channel18 (L4_18.3), Zotino-connector (J5.5 J15.B3)
DAC_OUT_N19: U_Output_channel19 (L4_19.3), Zotino-connector (J5.8 J15.A6)
DAC_OUT_N20: U_Output_channel20 (L4_20.3), Zotino-connector (J5.11 J15.B6)
DAC_OUT_N21: U_Output_channel21 (L4_21.3), Zotino-connector (J5.14 J15.A14)
DAC_OUT_N22: U_Output_channel22 (L4_22.3), Zotino-connector (J5.17 J15.B14)
DAC_OUT_N23: U_Output_channel23 (L4_23.3), Zotino-connector (J5.20 J15.A17)
DAC_OUT_N24: U_Output_channel24 (L4_24.3), Zotino-connector (J5.23 J15.B17)
DAC_OUT_N25: U_Output_channel25 (L4_25.3), Zotino-connector (J7.2 J14.A3)
DAC_OUT_N26: U_Output_channel26 (L4_26.3), Zotino-connector (J7.5 J14.B3)
DAC_OUT_N27: U_Output_channel27 (L4_27.3), Zotino-connector (J7.8 J14.A6)
DAC_OUT_N28: U_Output_channel28 (L4_28.3), Zotino-connector (J7.11 J14.B6)
DAC_OUT_N29: U_Output_channel29 (L4_29.3), Zotino-connector (J7.14 J14.A14)
DAC_OUT_N30: U_Output_channel30 (L4_30.3), Zotino-connector (J7.17 J14.B14)
DAC_OUT_N31: U_Output_channel31 (L4_31.3), Zotino-connector (J7.20 J14.A17)
DAC_OUT_N32: U_Output_channel32 (L4_32.3), Zotino-connector (J7.23 J14.B17)
DAC_OUT_P1: U_Output_channel1 (L4_1.4), Zotino-connector (J1.A2 J3.1)
DAC_OUT_P2: U_Output_channel2 (L4_2.4), Zotino-connector (J1.B2 J3.4)
DAC_OUT_P3: U_Output_channel3 (L4_3.4), Zotino-connector (J1.A5 J3.7)
DAC_OUT_P4: U_Output_channel4 (L4_4.4), Zotino-connector (J1.B5 J3.10)
DAC_OUT_P5: U_Output_channel5 (L4_5.4), Zotino-connector (J1.A13 J3.13)
DAC_OUT_P6: U_Output_channel6 (L4_6.4), Zotino-connector (J1.B13 J3.16)
DAC_OUT_P7: U_Output_channel7 (L4_7.4), Zotino-connector (J1.A16 J3.19)
DAC_OUT_P8: U_Output_channel8 (L4_8.4), Zotino-connector (J1.B16 J3.22)
DAC_OUT_P9: U_Output_channel9 (L4_9.4), Zotino-connector (J4.1 J13.A2)
DAC_OUT_P10: U_Output_channel10 (L4_10.4), Zotino-connector (J4.4 J13.B2)
DAC_OUT_P11: U_Output_channel11 (L4_11.4), Zotino-connector (J4.7 J13.A5)
DAC_OUT_P12: U_Output_channel12 (L4_12.4), Zotino-connector (J4.10 J13.B5)
DAC_OUT_P13: U_Output_channel13 (L4_13.4), Zotino-connector (J4.13 J13.A13)
DAC_OUT_P14: U_Output_channel14 (L4_14.4), Zotino-connector (J4.16 J13.B13)
DAC_OUT_P15: U_Output_channel15 (L4_15.4), Zotino-connector (J4.19 J13.A16)
DAC_OUT_P16: U_Output_channel16 (L4_16.4), Zotino-connector (J4.22 J13.B16)
DAC_OUT_P17: U_Output_channel17 (L4_17.4), Zotino-connector (J5.1 J15.A2)
DAC_OUT_P18: U_Output_channel18 (L4_18.4), Zotino-connector (J5.4 J15.B2)
DAC_OUT_P19: U_Output_channel19 (L4_19.4), Zotino-connector (J5.7 J15.A5)
DAC_OUT_P20: U_Output_channel20 (L4_20.4), Zotino-connector (J5.10 J15.B5)
DAC_OUT_P21: U_Output_channel21 (L4_21.4), Zotino-connector (J5.13 J15.A13)
DAC_OUT_P22: U_Output_channel22 (L4_22.4), Zotino-connector (J5.16 J15.B13)
DAC_OUT_P23: U_Output_channel23 (L4_23.4), Zotino-connector (J5.19 J15.A16)
DAC_OUT_P24: U_Output_channel24 (L4_24.4), Zotino-connector (J5.22 J15.B16)
DAC_OUT_P25: U_Output_channel25 (L4_25.4), Zotino-connector (J7.1 J14.A2)
DAC_OUT_P26: U_Output_channel26 (L4_26.4), Zotino-connector (J7.4 J14.B2)
DAC_OUT_P27: U_Output_channel27 (L4_27.4), Zotino-connector (J7.7 J14.A5)
DAC_OUT_P28: U_Output_channel28 (L4_28.4), Zotino-connector (J7.10 J14.B5)
DAC_OUT_P29: U_Output_channel29 (L4_29.4), Zotino-connector (J7.13 J14.A13)
DAC_OUT_P30: U_Output_channel30 (L4_30.4), Zotino-connector (J7.16 J14.B13)
DAC_OUT_P31: U_Output_channel31 (L4_31.4), Zotino-connector (J7.19 J14.A16)
DAC_OUT_P32: U_Output_channel32 (L4_32.4), Zotino-connector (J7.22 J14.B16)
I2C_SCL: LVDS_IFC_DAC (6 pins), Zotino-connector (IC30.12)
I2C_SDA: LVDS_IFC_DAC (6 pins), Zotino-connector (IC30.13)
LDACn: DAC_32CH (IC5.63 IC18.63 TP17.1), LVDS_IFC_DAC (R101.1)
PWR_EN: Supply_DAC (IC7.5 IC35.3), DIOT_Connectors_P1_P6 (R183.2)
RESETn: Zotino-DIOT (IC19.2), DAC_32CH (IC5.1 IC18.1 TP16.1)
SCKI: Zotino-DIOT (IC23.11 R117.2), DAC_32CH (IC5.54 IC18.54 R82.2 TP1.1), LVDS_IFC_DAC (R11.1)
SDI: Zotino-DIOT (IC23.14 R116.2), DAC_32CH (IC5.55 IC18.55 R58.2 TP2.1), LVDS_IFC_DAC (R13.1)
SDO: DAC_32CH (IC5.56 IC18.56 TP3.1), LVDS_IFC_DAC (R14.1)
SERVMOD_3V3: LVDS_IFC_DAC (IC15.5 IC15.13), DIOT_Connectors_P1_P6 (R205.1 R298.2)
VOUT1: U_Output_channel1 (R24_1.1), DAC_32CH (IC5.42 IC18.42)
VOUT2: U_Output_channel2 (R24_2.1), DAC_32CH (IC5.43 IC18.43)
VOUT3: U_Output_channel3 (R24_3.1), DAC_32CH (IC5.44 IC18.44)
VOUT4: U_Output_channel4 (R24_4.1), DAC_32CH (IC5.45 IC18.45)
VOUT5: U_Output_channel5 (R24_5.1), DAC_32CH (IC5.47 IC18.47)
VOUT6: U_Output_channel6 (R24_6.1), DAC_32CH (IC5.48 IC18.48)
VOUT7: U_Output_channel7 (R24_7.1), DAC_32CH (IC5.49 IC18.49)
VOUT8: U_Output_channel8 (R24_8.1), DAC_32CH (IC5.50 IC18.50)
VOUT9: U_Output_channel9 (R24_9.1), DAC_32CH (IC5.21 IC18.21)
VOUT10: U_Output_channel10 (R24_10.1), DAC_32CH (IC5.22 IC18.22)
VOUT11: U_Output_channel11 (R24_11.1), DAC_32CH (IC5.23 IC18.23)
VOUT12: U_Output_channel12 (R24_12.1), DAC_32CH (IC5.24 IC18.24)
VOUT13: U_Output_channel13 (R24_13.1), DAC_32CH (IC5.26 IC18.26)
VOUT14: U_Output_channel14 (R24_14.1), DAC_32CH (IC5.27 IC18.27)
VOUT15: U_Output_channel15 (R24_15.1), DAC_32CH (IC5.28 IC18.28)
VOUT16: U_Output_channel16 (R24_16.1), DAC_32CH (IC5.29 IC18.29)
VOUT17: U_Output_channel17 (R24_17.1), DAC_32CH (IC5.30 IC18.30)
VOUT18: U_Output_channel18 (R24_18.1), DAC_32CH (IC5.31 IC18.31)
VOUT19: U_Output_channel19 (R24_19.1), DAC_32CH (IC5.32 IC18.32)
VOUT20: U_Output_channel20 (R24_20.1), DAC_32CH (IC5.33 IC18.33)
VOUT21: U_Output_channel21 (R24_21.1), DAC_32CH (IC5.37 IC18.37)
VOUT22: U_Output_channel22 (R24_22.1), DAC_32CH (IC5.38 IC18.38)
VOUT23: U_Output_channel23 (R24_23.1), DAC_32CH (IC5.39 IC18.39)
VOUT24: U_Output_channel24 (R24_24.1), DAC_32CH (IC5.40 IC18.40)
VOUT25: U_Output_channel25 (R24_25.1), DAC_32CH (IC5.60 IC18.60)
VOUT26: U_Output_channel26 (R24_26.1), DAC_32CH (IC5.61 IC18.61)
VOUT27: U_Output_channel27 (R24_27.1), DAC_32CH (IC5.62 IC18.62)
VOUT28: U_Output_channel28 (R24_28.1), DAC_32CH (IC5.3 IC18.3)
VOUT29: U_Output_channel29 (R24_29.1), DAC_32CH (IC5.5 IC18.5)
VOUT30: U_Output_channel30 (R24_30.1), DAC_32CH (IC5.6 IC18.6)
VOUT31: U_Output_channel31 (R24_31.1), DAC_32CH (IC5.7 IC18.7)
VOUT32: U_Output_channel32 (R24_32.1), DAC_32CH (IC5.8 IC18.8)

## Assembly variants
QFN: not fitted CLIP28 CLIP29 CLIP30 CLIP31 CLIP32 CLIP33 CLIP34 CLIP37 CLIP38 CLIP39 CLIP40 CLIP41 CLIP42 CLIP43 CLIP44 CLIP45 CLIP46 CLIP47 IC1 IC4 IC5 IC14 IC32 IC35 L16 R1 R4 R15 R26 R30 R31 R32 R36 R68_1 R68_2 R68_3 R68_4 R68_5 R68_6 R68_7 R68_8 R68_9 R68_10 R68_11 R68_12 R68_13 R68_14 R68_15 R68_16 R68_17 R68_18 R68_19 R68_20 R68_21 R68_22 R68_23 R68_24 R68_25 R68_26 R68_27 R68_28 R68_29 R68_30 R68_31 R68_32 R162 R164